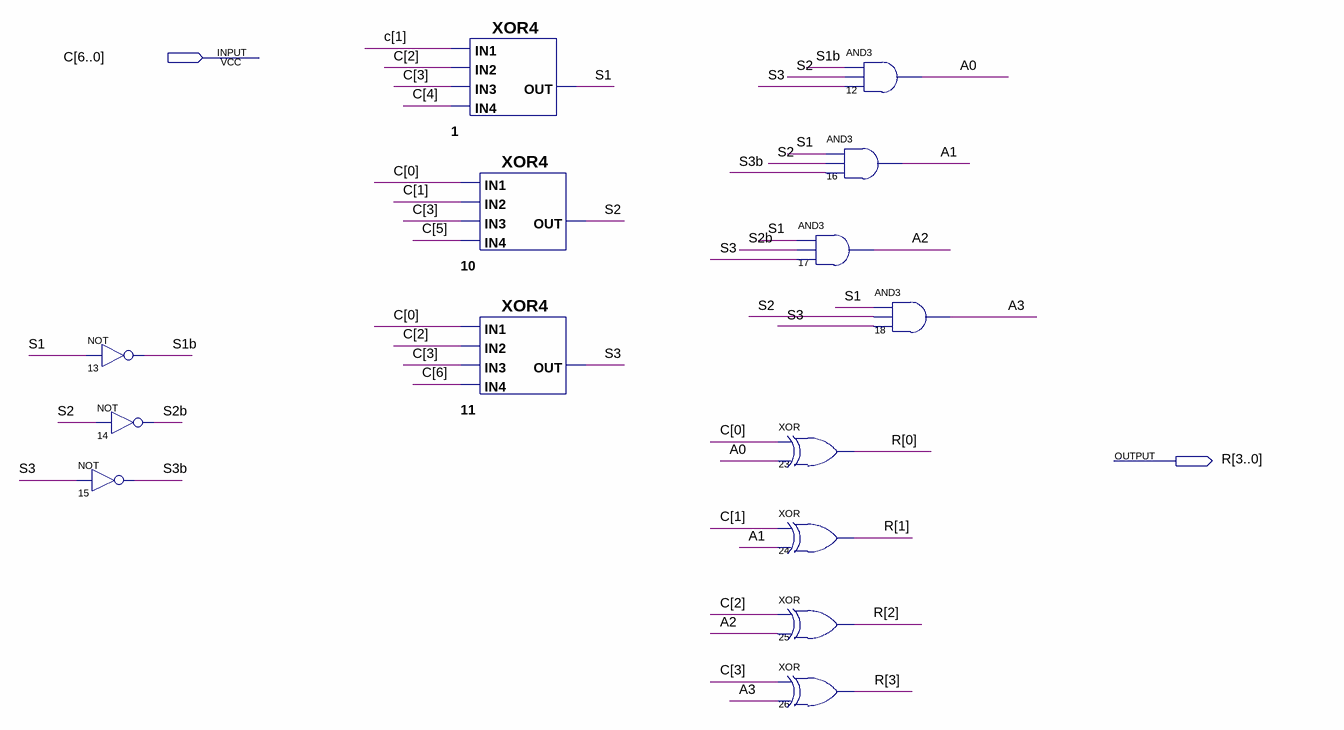
[diagram p0: schematic sheet]
// Quartus schematic Decodeur74.bdf as structural Verilog: 14 symbols, 2 pins
module Decodeur74 (
  input  [6:0] C,
  output [3:0] R
);

  wire A0, A1, A2, A3, S1, S1b, S2, S2b, S3, S3b;

  not u_13 (S1b, S1);
  not u_14 (S2b, S2);
  not u_15 (S3b, S3);
  XOR4 u_1 (.IN4(C[4]), .IN3(C[3]), .IN2(C[2]), .IN1(C[1]), .OUT(S1));
  XOR4 u_10 (.IN4(C[5]), .IN3(C[3]), .IN2(C[1]), .IN1(C[0]), .OUT(S2));
  XOR4 u_11 (.IN4(C[6]), .IN3(C[3]), .IN2(C[2]), .IN1(C[0]), .OUT(S3));
  xor u_23 (R[0], C[0], A0);
  xor u_24 (R[1], C[1], A1);
  xor u_25 (R[2], C[2], A2);
  xor u_26 (R[3], C[3], A3);
  and u_12 (A0, S1b, S2, S3);
  and u_16 (A1, S1, S2, S3b);
  and u_17 (A2, S1, S2b, S3);
  and u_18 (A3, S1, S2, S3);
endmodule
